# Altium schematic sheet Power_supply.SchDoc
size 420 x 297 mm; Address1: Address1; Address2: Address2; Address3: Address3; Address4: Address4; DocumentNumber: *Э3; SheetNumber: 4; SheetTotal: 11; DocumentType: Схема электрическая *
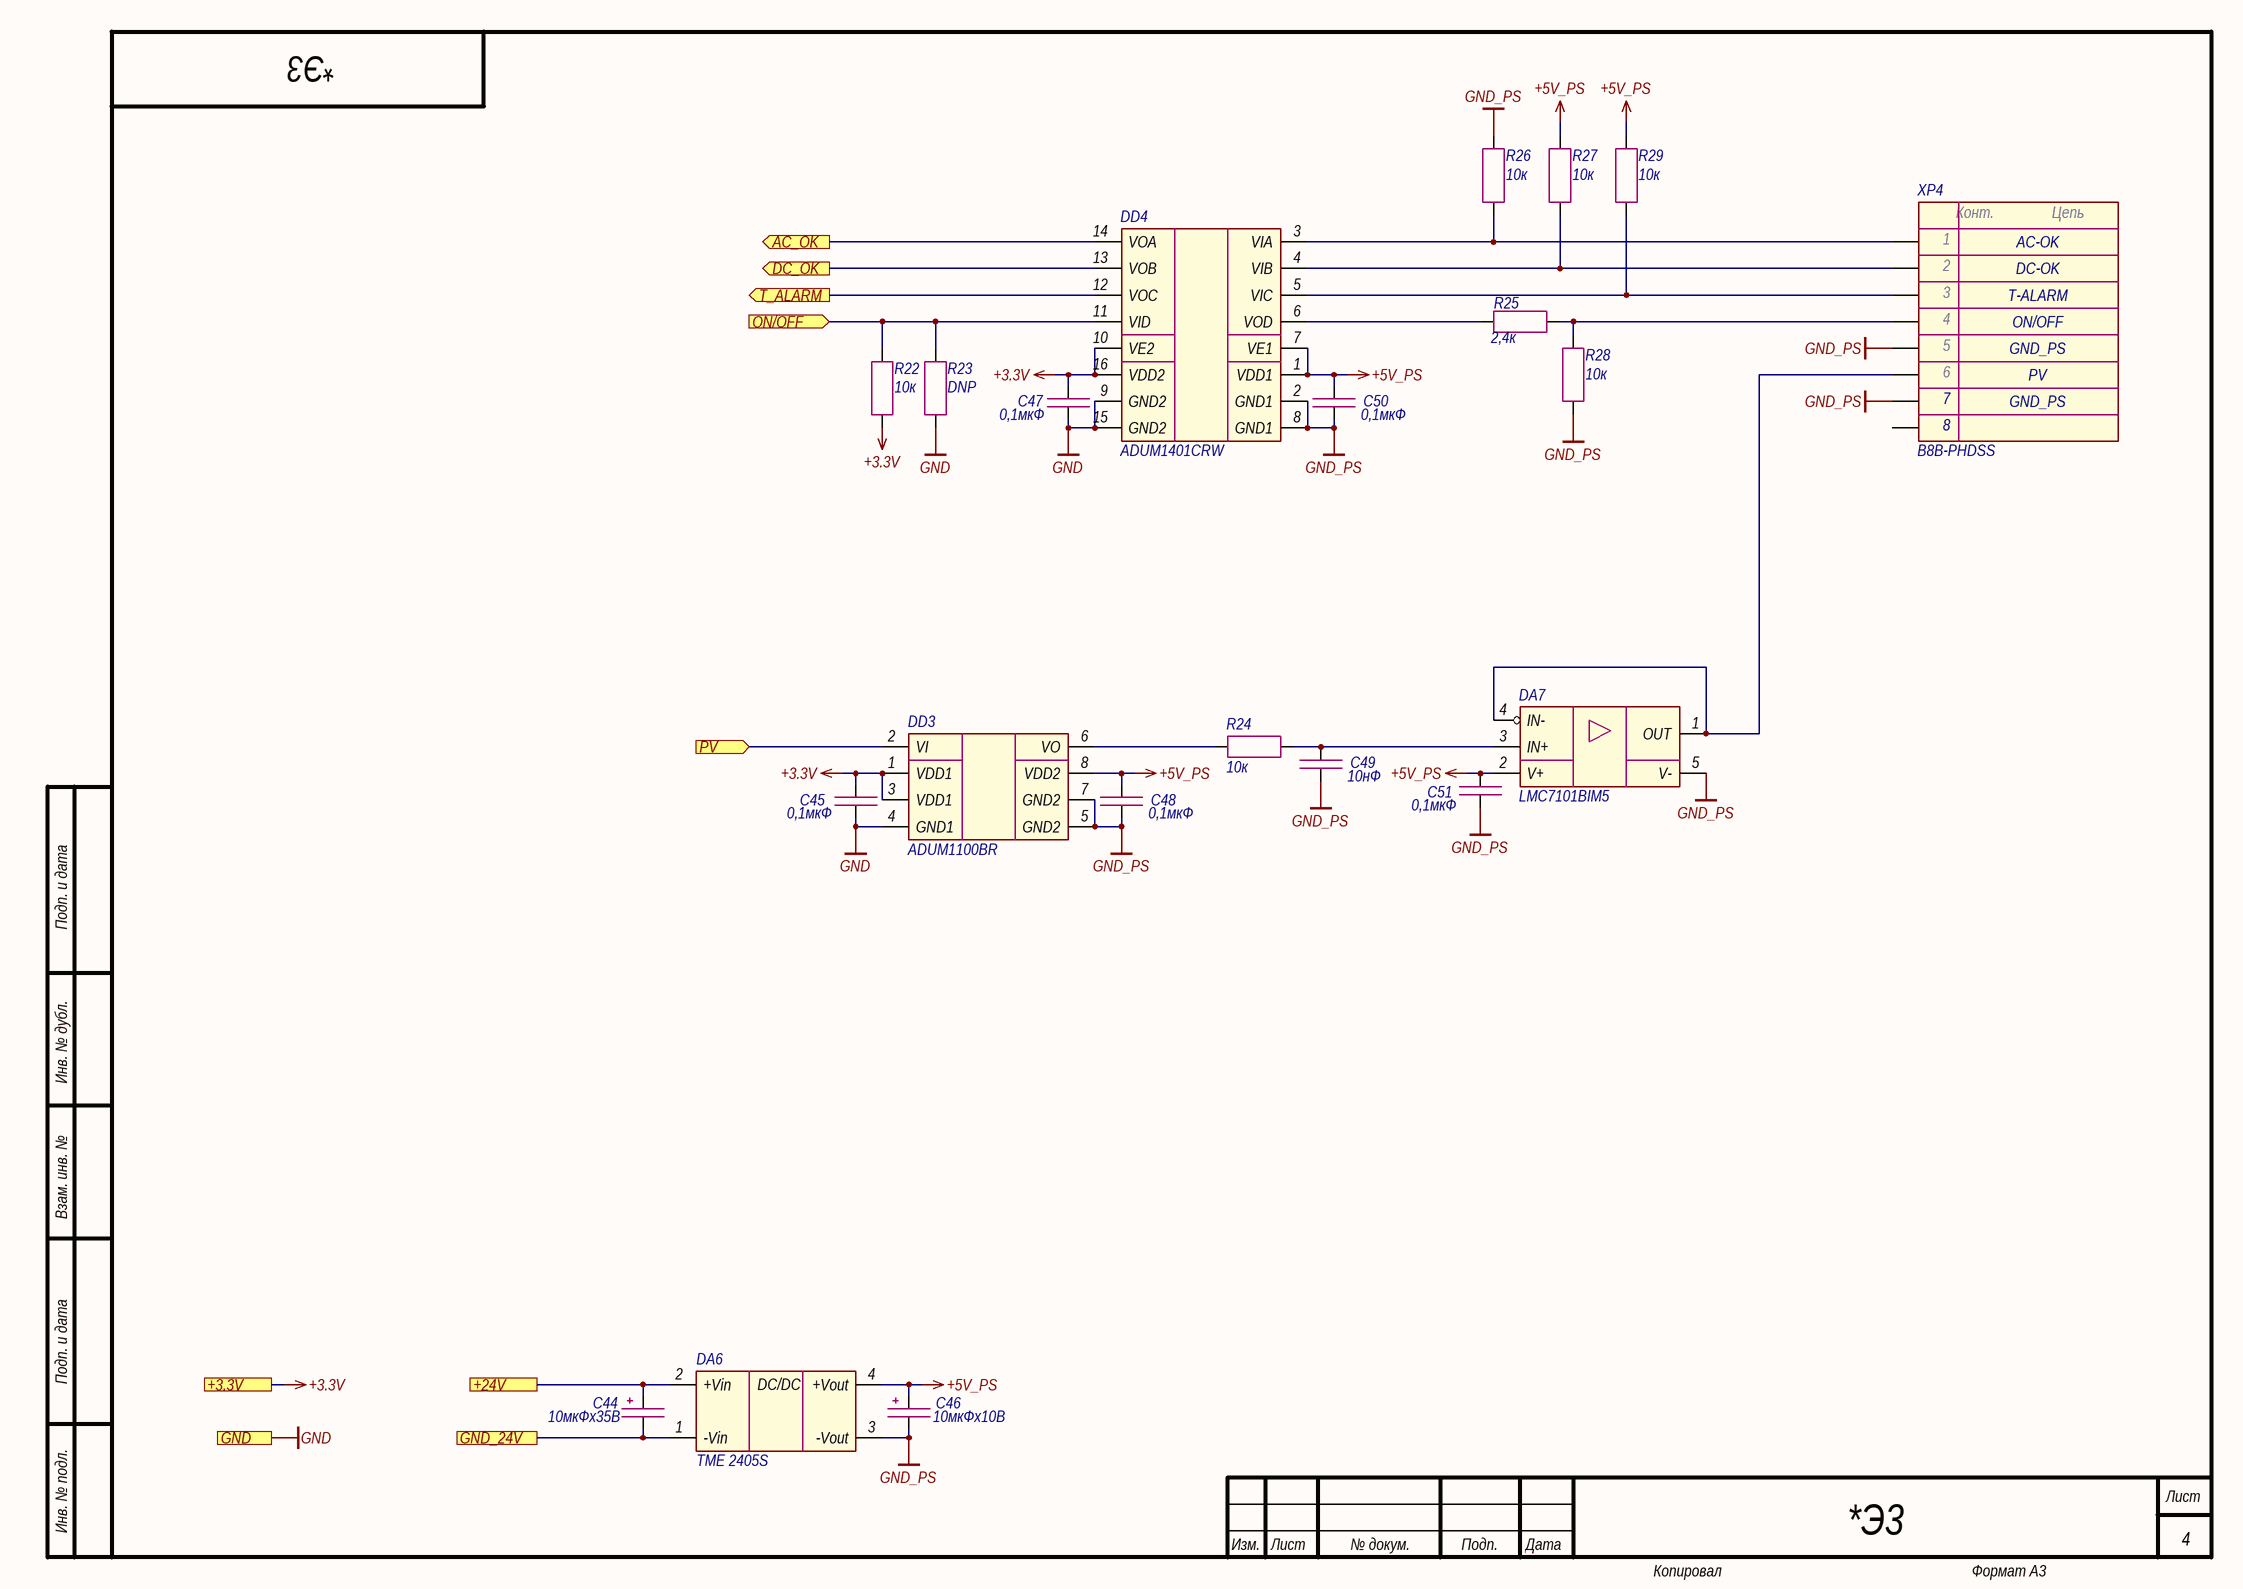
[diagram p0: Power_supply.SchDoc]

## Parts
C44  10мкФх35B  [CAP_C]
C45  0,1мкФ  [CAP_0603]
C46  10мкФх10B  [CAP_A]
C47  0,1мкФ  [CAP_0603]
C48  0,1мкФ  [CAP_0603]
C49  10нФ  [CAP_0603]
C50  0,1мкФ  [CAP_0603]
C51  0,1мкФ  [CAP_0603]
DA6  TME 2405S  [TME (SIP-4)]
DA7  LMC7101BIM5  [SOT-23-5]
DD3  ADUM1100BR  [SOIC-8]
DD4  ADUM1401CRW  [SOIC-16W]
R22  10к  [RES_0603]
R23  DNP  [RES_0603]
R24  10к  [RES_0603]
R25  2,4к  [RES_0603]
R26  10к  [RES_0603]
R27  10к  [RES_0603]
R28  10к  [RES_0603]
R29  10к  [RES_0603]
XP4  B8B-PHDSS  [B8B-PHDSS]

## Ports
+3.3V (see Main[2B], Ethernet[3D], Fiber_interlock[2C], Flow_sensor[2C], Hardwiring[3D], LD_driver[1D]), +24V (see Main[1B], Flow_sensor[2C], Hardwiring[3C], Indication[1C], LD_driver[1D]), AC_OK (out, see Main[2B]), DC_OK (out, see Main[2B]), GND (see Main[2B], Ethernet[3D], Fiber_interlock[2C], Flow_sensor[2C], Guide_laser[1C], Hardwiring[3D], Indication[1C], LD_driver[1D]), GND_24V (see Main[1B], Flow_sensor[2C], Hardwiring[3C], Indication[1C], LD_driver[1D]), ON/OFF (in, see Main[1B]), PV (in, see Main[1B]), T_ALARM (out, see Main[2B])

## Nets
+3.3V: C45.1 C47.1 DD3.1(VDD1) DD3.3(VDD1) DD4.10(VE2) DD4.16(VDD2) R22.1 ; port +3.3V
+5V_PS: C46.1 C48.1 C50.1 C51.1 DA6.4(+Vout) DA7.2(V+) DD3.8(VDD2) DD4.1(VDD1) DD4.7(VE1) R27.1 R29.1
GND: C45.2 C47.2 DD3.4(GND1) DD4.9(GND2) DD4.15(GND2) R23.1 ; port GND
GND_PS: C46.2 C48.2 C49.2 C50.2 C51.2 DA6.3(-Vout) DA7.5(V-) DD3.5(GND2) DD3.7(GND2) DD4.2(GND1) DD4.8(GND1) R26.1 R28.2 XP4.5 XP4.7
+24V: C44.1 DA6.2(+Vin) ; port +24V
AC_OK: DD4.14(VOA) ; port AC_OK
DC_OK: DD4.13(VOB) ; port DC_OK
GND_24V: C44.2 DA6.1(-Vin) ; port GND_24V
ON/OFF: DD4.11(VID) R22.2 R23.2 ; port ON/OFF
PV: DD3.2(VI) ; port PV
T_ALARM: DD4.12(VOC) ; port T_ALARM
NetC49_1: C49.1 DA7.3(IN+) R24.2
NetDA7_1: DA7.1(OUT) DA7.4(IN-) XP4.6
NetDD3_6: DD3.6(VO) R24.1
NetDD4_3: DD4.3(VIA) R26.2 XP4.1
NetDD4_4: DD4.4(VIB) R27.2 XP4.2
NetDD4_5: DD4.5(VIC) R29.2 XP4.3
NetDD4_6: DD4.6(VOD) R25.2
NetR25_1: R25.1 R28.1 XP4.4

Not connected (* = marked no-connect by the designer): XP4 8

## Notes on the sheet
- AC-OK
- DC-OK
- T-ALARM
- ON/OFF
- GND_PS
- PV
- Подп. и дата
- Инв. № дубл.
- Взам. инв. №
- Инв. № подл.
- Изм.
- Лист
- № докум.
- Подп.
- Дата
- Копировал
- Формат А3
- (in symbol Connector-8) Конт.; Цепь
- (in symbol TME) DC/DC

## Library data of the parts
C44 = Capacitor_Polar: Model: TECAP, 10 мкФ, 35 В, тип C, 10%; Value: 10мкФх35B; Document: *; Manufacturer: *
C45 C47 C48 C50 C51 = Capacitor: Manufacturer: Murata; Model: GRM188R71H104KA93D; Value: 0,1мкФ; Document: *
C46 = Capacitor_Polar: Model: TECAP, 10 мкФ, 10 В, тип A, 10%; Value: 10мкФх10B; Document: *; Manufacturer: *
C49 = Capacitor: Manufacturer: Murata; Model: GRM188R71H103JA01D; Value: 10нФ; Document: *
DA6 = TME: Manufacturer: Traco Power; Model: TME 2405S; Document: *
DA7 = LMC7101: Manufacturer: Texas Instruments; Model: LMC7101BIM5; Document: *
DD3 = ADUM1100: Manufacturer: Analog Devices; Model: ADUM1100BR; Document: *
DD4 = ADUM1401: Manufacturer: Analog Devices; Model: ADUM1401CRW; Document: *
R22 R24 R26-R29 = Resistor: Manufacturer: Yageo; Model: RC0603FR-0710KL; Value: 10к; Document: *
R23 = Resistor: Value: DNP; Model: DNP; Document: *; Manufacturer: *
R25 = Resistor: Manufacturer: Yageo; Model: RC0603FR-072K4L; Value: 2,4к; Document: *
XP4 = Connector-8: Manufacturer: JST; Model: B8B-PHDSS; Document: *